# Altium schematic sheet Dynamixel_hex_pcb.SchDoc
size 297 x 209 mm
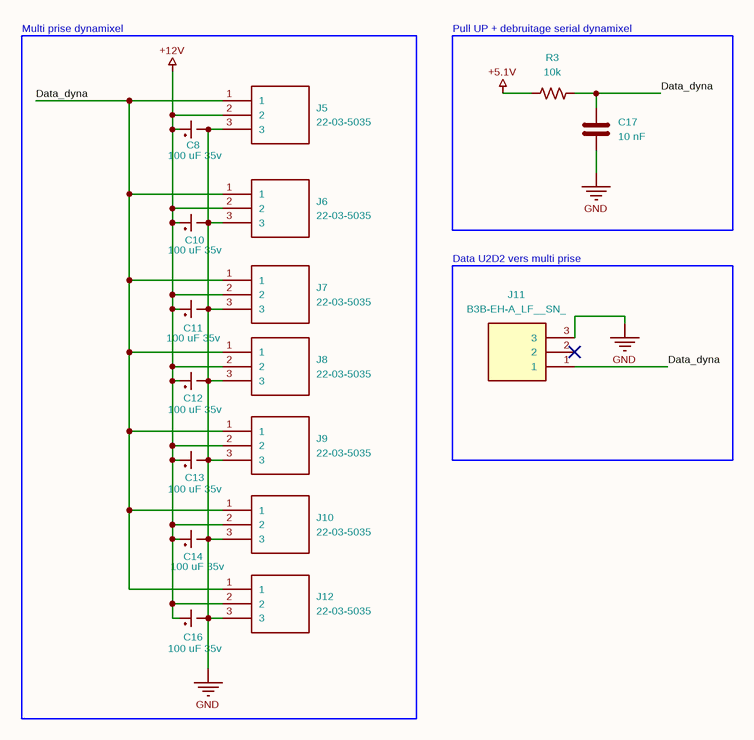
[diagram p0: Dynamixel_hex_pcb.SchDoc]

## Parts
C8  100 uF 35v  [CP_Wurth_WCAP-HSG5-D6.3L7.7]
C10  100 uF 35v  [CP_Wurth_WCAP-HSG5-D6.3L7.7]
C11  100 uF 35v  [CP_Wurth_WCAP-HSG5-D6.3L7.7]
C12  100 uF 35v  [CP_Wurth_WCAP-HSG5-D6.3L7.7]
C13  100 uF 35v  [CP_Wurth_WCAP-HSG5-D6.3L7.7]
C14  100 uF 35v  [CP_Wurth_WCAP-HSG5-D6.3L7.7]
C16  100 uF 35v  [CP_Wurth_WCAP-HSG5-D6.3L7.7]
C17  10 nF  [C_0603_1608Metric]
J5  22-03-5035  [Molex_SPOX_5267-03A_1x03_P2.50mm_Vertical]
J6  22-03-5035  [Molex_SPOX_5267-03A_1x03_P2.50mm_Vertical]
J7  22-03-5035  [Molex_SPOX_5267-03A_1x03_P2.50mm_Vertical]
J8  22-03-5035  [Molex_SPOX_5267-03A_1x03_P2.50mm_Vertical]
J9  22-03-5035  [Molex_SPOX_5267-03A_1x03_P2.50mm_Vertical]
J10  22-03-5035  [Molex_SPOX_5267-03A_1x03_P2.50mm_Vertical]
J11  B3B-EH-A_LF__SN_  [JST_EH_B3B-EH-A_1x03_P2.50mm_Vertical]
J12  22-03-5035  [Molex_SPOX_5267-03A_1x03_P2.50mm_Vertical]
R3  10k  [R_0201_0603Metric]

## Blocks framed on the sheet
Multi prise dynamixel: C8 C10-C14 C16 J5-J10 J12
Pull UP + debruitage serial dynamixel: C17 R3
Data U2D2 vers multi prise: J11

## Nets
+5.1V: R3.1
+12V: C8.1 C10.1 C11.1 C12.1 C13.1 C14.1 C16.1 J5.2 J6.2 J7.2 J8.2 J9.2 J10.2 J12.2
GND: C8.2 C10.2 C11.2 C12.2 C13.2 C14.2 C16.2 C17.2 J5.3 J6.3 J7.3 J8.3 J9.3 J10.3 J11.3 J12.3
Data_dyna: C17.1 J5.1 J6.1 J7.1 J8.1 J9.1 J10.1 J11.1 J12.1 R3.2

Not connected (* = marked no-connect by the designer): J11 2*

## Notes on the sheet
- 1
- 2
- 3
- 4
- 5
- 6
- A
- B
- C
- Multiprise Dynamixel + Data U2D2
- D
- Title: Dynamixel Hexapode
- File: Dynamixel_hex_pcb.kicad_sch
- Sheet: /
- ECE Makers
- KiCad E.D.A.  kicad (5.1.4)-1
- Size: A4
- Date: 2025-03-28
- Rev: 1.1
- Id: 1/1

## Library data of the parts
C8 C10-C14 C16 = C_Polarized_Small_US: Value: 100 uF 35v; Footprint: footprints:CP_Wurth_WCAP-HSG5-D6.3L7.7
C17 = C: Value: 10 nF; Footprint: Capacitor_SMD:C_0603_1608Metric
J5-J10 J12 = 22-03-5035: Manufacturer_Name: Molex; Height: 5.9; Mouser Part Number: 538-22-03-5035; Mouser Price/Stock: https://www.mouser.co.uk/ProductDetail/Molex/22-03-5035?qs=VKrXD49J9Ep%252Bv2WwbOoiPA%3D%3D; Manufacturer_Part_Number: 22-03-5035; Value: 22-03-5035; Footprint: Connector_Molex:Molex_SPOX_5267-03A_1x03_P2.50mm_Vertical
J11 = B3B-EH-A_LF__SN_: Manufacturer_Name: JST (JAPAN SOLDERLESS TERMINALS); Manufacturer_Part_Number: B3B-EH-A(LF)(SN); Height: 6; Mouser Part Number: 306-B3BEHALFSNP; Mouser Price/Stock: https://www.mouser.co.uk/ProductDetail/JST-Commercial/B3B-EH-ALFSN?qs=cdbOS8ANM9BrLnX9Tj37TA%3D%3D; Value: B3B-EH-A_LF__SN_; Footprint: Connector_JST:JST_EH_B3B-EH-A_1x03_P2.50mm_Vertical
R3 = R_US: Value: 10k; Footprint: Resistor_SMD:R_0201_0603Metric